# Altium schematic sheet MCU.SchDoc
size A4; SheetNumber: 5; SheetTotal: 6
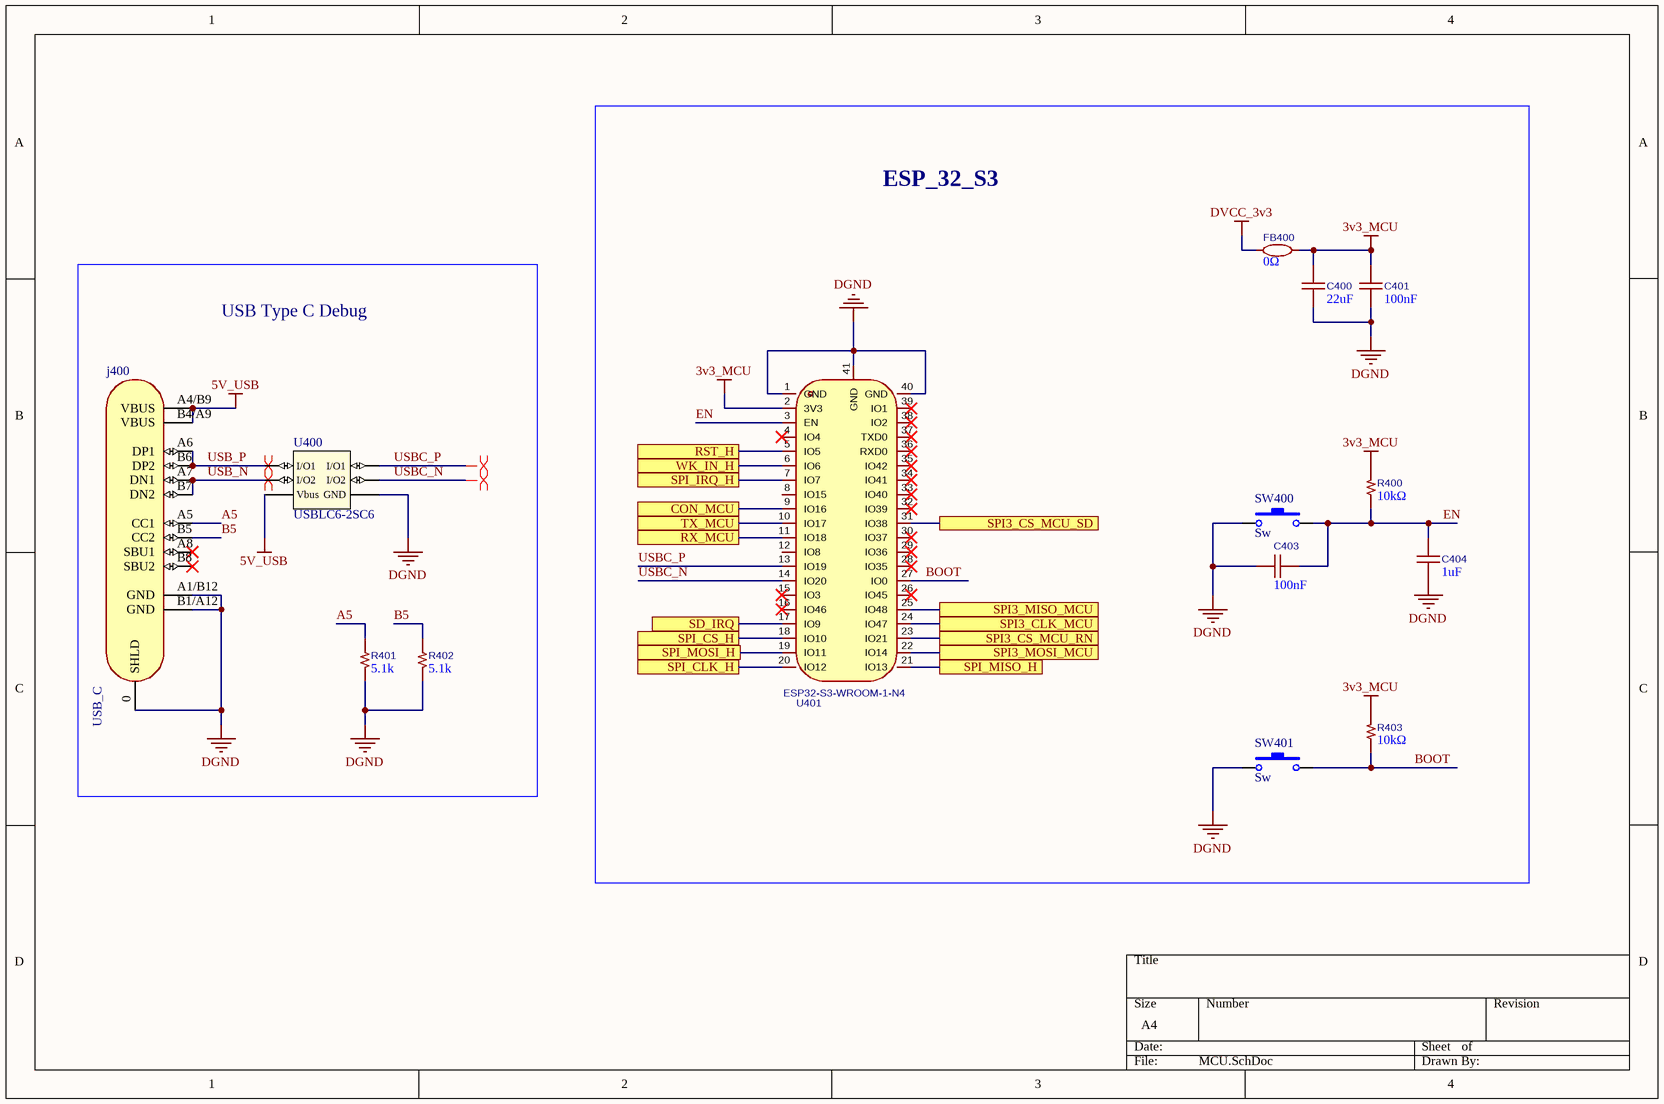
[diagram p0: MCU.SchDoc]

## Parts
C400  value 22uF  [0805_cap]  (hidden comment: Chinocera HGC0805R5226K100NSLJ)
C401  value 100nF  [0603_cap]  (hidden comment: AIDE CAPACITOR 0603X7R104K250NT)
C403  value 100nF  [0603_cap]  (hidden comment: AIDE CAPACITOR 0603X7R104K250NT)
C404  value 1uF  [0603_cap]  (hidden comment: CL10B105KB8NQNC)
FB400  value 0Ω  [0603_cap]  (hidden comment: Yanchuang SCBM160808U090T)
j400  value USB_C  [CON_USB_C_16P_RA]  (hidden comment: USB C)
R400  value 10kΩ  [0603_RES]  (hidden comment: SAE 1RC0603F1002)
R401  value 5.1k  [0603_RES]  (hidden comment: UNI-ROYAL HP05W3F100JT5E)
R402  value 5.1k  [0603_RES]  (hidden comment: UNI-ROYAL HP05W3F100JT5E)
R403  value 10kΩ  [0603_RES]  (hidden comment: SAE 1RC0603F1002)
SW400  Sw  [Sw_PUSH_4.5x4.5x5mm]
SW401  Sw  [Sw_PUSH_4.5x4.5x5mm]
U400  USBLC6-2SC6  [SOT_23_6]
U401  esp32-s3-wroom-1-n4  [WIFIM-SMD_ESP32-S3-WROOM-1-N8]

## Blocks framed on the sheet
ESP_32_S3: C400 C401 C403 C404 FB400 R400 R403 SW400 SW401 U401
USB Type C Debug: j400 R401 R402 U400

## Ports
CON_MCU (see MAIN[3B], INTERFACES[1A]), RST_H (see MAIN[3B], INTERFACES[1C]), RX_MCU (see MAIN[3B], INTERFACES[1A]), SD_IRQ (see MAIN[3B], INTERFACES[3C]), SPI3_CLK_MCU (see MAIN[2B], MEASURES[4C]), SPI3_CS_MCU_RN (see MAIN[2B], MEASURES[4C]), SPI3_CS_MCU_SD (see MAIN[3B], INTERFACES[3B]), SPI3_MISO_MCU (see MAIN[2B], MEASURES[4C]), SPI3_MOSI_MCU (see MAIN[2B], MEASURES[4C]), SPI_CLK_H (see MAIN[3B], INTERFACES[1D]), SPI_CS_H (see MAIN[3B], INTERFACES[1C]), SPI_IRQ_H (see MAIN[3B], INTERFACES[1C]), SPI_MISO_H (see MAIN[3B], INTERFACES[1D]), SPI_MOSI_H (see MAIN[3B], INTERFACES[1D]), TX_MCU (see MAIN[3B], INTERFACES[1B]), WK_IN_H (see MAIN[3B], INTERFACES[1C])

## Nets
3v3_MCU: C400.2 C401.2 FB400.1 R400.2 R403.2 U401.2(3V3)
5V_USB: j400.A4/B9(VBUS) j400.B4/A9(VBUS) U400.5(Vbus)
DGND: C400.1 C401.1 C403.2 C404.1 j400.0(SHLD) j400.A1/B12(GND) j400.B1/A12(GND) R401.2 R402.2 SW400.1 SW401.1 U400.2(GND) U401.1(GND) U401.40(GND) U401.41(GND)
DVCC_3v3: FB400.2
A5: j400.A5(CC1) R401.1
B5: j400.B5(CC2) R402.1
BOOT: R403.1 SW401.2 U401.27(IO0)
CON_MCU: U401.9(IO16) ; port CON_MCU
EN: C403.1 C404.2 R400.1 SW400.2 U401.3(EN)
RST_H: U401.5(IO5) ; port RST_H
RX_MCU: U401.11(IO18) ; port RX_MCU
SD_IRQ: U401.17(IO9) ; port SD_IRQ
SPI3_CLK_MCU: U401.24(IO47) ; port SPI3_CLK_MCU
SPI3_CS_MCU_RN: U401.23(IO21) ; port SPI3_CS_MCU_RN
SPI3_CS_MCU_SD: U401.31(IO38) ; port SPI3_CS_MCU_SD
SPI3_MISO_MCU: U401.25(IO48) ; port SPI3_MISO_MCU
SPI3_MOSI_MCU: U401.22(IO14) ; port SPI3_MOSI_MCU
SPI_CLK_H: U401.20(IO12) ; port SPI_CLK_H
SPI_CS_H: U401.18(IO10) ; port SPI_CS_H
SPI_IRQ_H: U401.7(IO7) ; port SPI_IRQ_H
SPI_MISO_H: U401.21(IO13) ; port SPI_MISO_H
SPI_MOSI_H: U401.19(IO11) ; port SPI_MOSI_H
TX_MCU: U401.10(IO17) ; port TX_MCU
USB_N: j400.A7(DN1) j400.B7(DN2) U400.4(I/O2)
USB_P: j400.A6(DP1) j400.B6(DP2) U400.6(I/O1)
USBC_N: U400.3(I/O2) U401.14(IO20)
USBC_P: U400.1(I/O1) U401.13(IO19)
WK_IN_H: U401.6(IO6) ; port WK_IN_H

Not connected (* = marked no-connect by the designer): j400 A8(SBU1)* B8(SBU2)*; U401 4(IO4)* 8(IO15) 12(IO8) 15(IO3)* 16(IO46)* 26(IO45)* 28(IO35)* 29(IO36)* 30(IO37)* 32(IO39)* 33(IO40)* 34(IO41)* 35(IO42)* 36(RXD0)* 37(TXD0)* 38(IO2)* 39(IO1)*

## Layout directives
differential pair: USB_N, USB_P, USBC_N, USBC_P

## Library data of the parts
C400 = CAP CER 22uF 10V X5R 0805: ComponentLink1Description: LCSC; ComponentLink1URL: https://www.lcsc.com/es/product-detail/C7432777.html?spm=wm.fly.bg.4.xh___wm.fly.dhl.mly.13-0-3&lcsc_vid=ElBYBFACR1JaVQdSQ1NeBFwHFAdfUFIFEwUNXlwCEVQxVlNfRlVWUFNWT1hWUDtW; Supplier 1: LCSC; Manufacturer 1: Chinocera; Manufacturer Part Number 1: HGC0805R5226K100NSLJ; Supplier Part Number 1: C7432777
C401 C403 = CAP CER 100nF 25V X7R 0603: ComponentLink1Description: LCSC; ComponentLink1URL: https://www.lcsc.com/product-detail/C465156.html?s_z=n_q_HGC0603G0150J500NTHJ; Supplier 1: LCSC; Manufacturer 1: AIDE CAPACITOR; Manufacturer Part Number 1: 0603X7R104K250NT; Supplier Part Number 1: C48579280
C404 = CAP CER 1uF 50V X7R 0603: Capacitance:1uF Tolerance:±20% Tolerance:±20% Voltage Rating:50V Ripple Current:- Equivalent Series Resistance(ESR):- Diameter:4mm Height - Seated (Max):5.4mm Lifetime:1000hrs@105℃ Operating Temperature:-45℃~+105℃ Operating Temperature:-45℃~+105℃; Manufacturer 1: Samsung Electro-Mechanics; ComponentLink1Description: LCSC; ComponentLink1URL: https://www.lcsc.com/es/product-detail/C5199872.html?spm=wm.fly.bg.9.xh&lcsc_vid=ElBYBFACR1JaVQdSQ1NeBFwHFAdfUFIFEwUNXlwCEVQxVlNfRlVWUFNWT1hWUDtW; Manufacturer Part Number 1: CL10B105KB8NQNC; Supplier 1: LSCS; Supplier Part Number 1: C5199872
FB400 = FERR_10mohms 15o@100MHz: 10mΩ 15Ω@100MHz 0603 Ferrite Beads and Chips; ComponentLink1Description: LCSC; ComponentLink1URL: https://www.lcsc.com/es/product-detail/C52205324.html?s_z=s_c_Ferrite%2520Beads%2520and%2520Chips&spm=wm.fly.bg.0.xh&lcsc_vid=T1EMUlBeR1ALUlVSFANeUFcFR1BWV1EHFVFaA1dQElAxVlNfRlJaVFNSQlhYUjsOAxUeFF5JWBYZEEoKFBINSQcJGk4LFEsFFhULAAsUDk5fVlNWWQkaCgg%3D; Supplier 1: LCSC; Supplier Part Number 1: C52205324; Manufacturer 1: Yanchuang; Manufacturer Part Number 1: SCBM160808U090T
j400 = CON_USB_TYPEC_16P: 3A USB 3.1 1 Surface Mount 16P Female -40℃~+85℃ Type-C SMD USB Connectors ROHS; Manufacturer 1: SHOU HAN; Manufacturer Part Number 1: TYPE-C-3.1-16PIN; Supplier 1: LCSC; Supplier Part Number 1: C7507405; ComponentLink1Description: LCSC; ComponentLink1URL: https://lcsc.com/product-detail/USB-Connectors_SHOU-HAN-TYPE-C-3-1-16PIN_C7507405.html
R400 R403 = RES_10kohms 100mW 75V: 10kΩ 100mW 75V Thick Film Resistor ±100ppm/℃ ±1% 0603 Chip Resistor - Surface Mount; ComponentLink1Description: New link; ComponentLink1URL: https://www.lcsc.com/es/product-detail/C53224186.html?spm=wm.fly.bg.4.xh___wm.fly.dhl.mly.13-6-1&lcsc_vid=T1EMUlBeR1ALUlVSFANeUFcFR1BWV1EHFVFaA1dQElAxVlNfRlJaV1FUQldbXzsOAxUeFF5JWBYZEEoKFBINSQcJGk4NBhYS; Manufacturer 1: SAE; Manufacturer Part Number 1: 1RC0603F1002; Supplier Part Number 1: C53224186; Supplier 1: LCSC
R401 R402 = RES 5.1Kohms ±1% 100mW 0603_1: 5.11kΩ 100mW 50V Thick Film Resistor ±1% ±100ppm/℃ 0603 Chip Resistor - Surface Mount; Manufacturer 1: HWA CHN; Manufacturer Part Number 1: HRC0603F5111ENTN; ComponentLink1Description: New link; ComponentLink1URL: https://www.lcsc.com/product-detail/C55098456.html; Supplier Part Number 1: C55098456; Supplier 1: LCSC
SW400 SW401 = Sw_PUSH_4.5x4.5x5.0xmm: SWITCH TACTILE SPST-NO 0.05A 12V; Manufacturer: BZCN; Manufacturer Part Number: TSC015A05026A; Supplier 1: LCSC; Supplier Part Number 1: C2888509; Last modified by: N-A.Potosi; Last modified date: 20190222; ComponentLink1Description: LCSC; ComponentLink1URL: https://www.lcsc.com/product-detail/Tactile-Switches_BZCN-TSC015A05026A_C2888509.html
U400 = TVS_5.25V_2CH_SOT_23_6: TVS DIODE 5.25V 17V SOT23-6; Manufacturer 1: STMicroelectronics; ComponentLink1Description: LCSC; ComponentLink1URL: https://www.lcsc.com/product-detail/ESD-Protection-Devices_STMicroelectronics-USBLC6-2SC6_C7519.html; Supplier 1: LCSC; Supplier Part Number 1: C7519; Manufacturer Part Number 1: USBLC6-2SC6
U401 = esp32-s3-wroom-1-n4: Utilized IC / Part:ESP32-S3 Wireless Standard:Bluetooth5.0 Interface Type:I2C；GPIO；UART；SPI；USB；I2S Frequency:2.4GHz Antenna Type:On-board PCB Antenna Output Power:20.5dBm Output Power:20.5dBm Voltage - Supply:3V~3.6V Voltage - Supply:3V~3.6V Receive  Cur; Manufacturer 1: ESPRESSIF; Symbol: ESP32-S3-WROOM-1-N4; Operating Temperature: -40℃~+85℃; ComponentLink1Description: LCSC; ComponentLink1URL: https://www.lcsc.com/product-detail/C2913197.html?s_z=h_q_esp32-s3-wroom-1-n4; Supplier 1: LCSC; Supplier Part Number 1: C2913197; Manufacturer Part Number 1: ESP32-S3-WROOM-1-N4